# Altium schematic sheet adj_current.SchDoc
size A; SheetNumber: 4; SheetTotal: 4
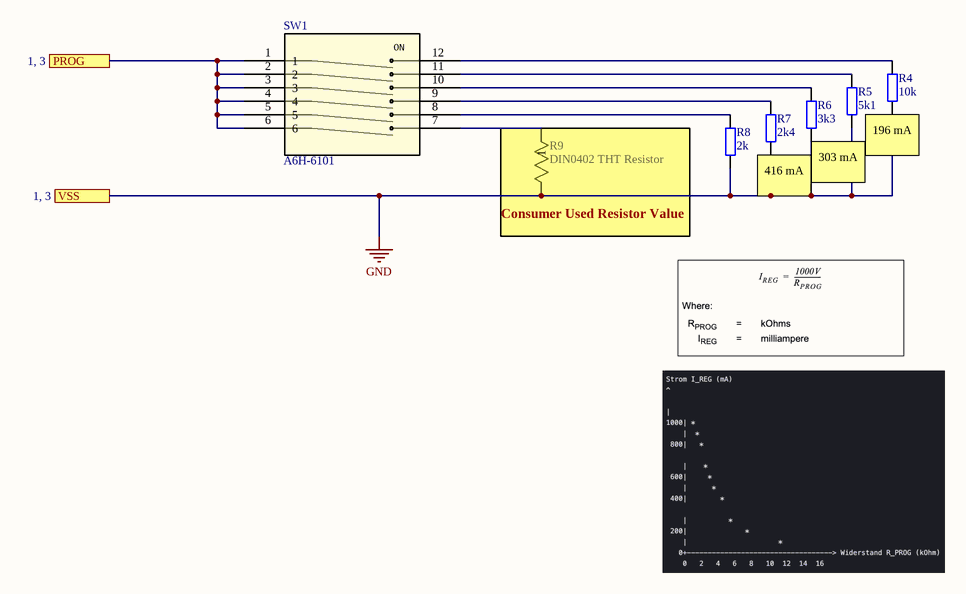
[diagram p0: adj_current.SchDoc]

## Parts
R4  10k  [RES_0603]
R5  5k1  [RES_0603]
R6  3k3  [RES_0603]
R7  2k4  [RES_0603]
R8  2k  [RES_0603]
R9  DIN0402 THT Resistor  [DIN0207 THT Resistor]
SW1  A6H-6101  [SW_A6H-6101_OMR]

## Blocks framed on the sheet
Consumer Used Resistor Value: R9

## Ports
PROG (see 1, 3), VSS (see 1, 3)

## Nets
GND: R4.2 R5.2 R6.2 R7.2 R8.2 R9.2 ; port VSS
PROG: SW1.1 SW1.2 SW1.3 SW1.4 SW1.5 SW1.6 ; port PROG
NetR4_1: R4.1 SW1.12
NetR5_1: R5.1 SW1.11
NetR6_1: R6.1 SW1.10
NetR7_1: R7.1 SW1.9
NetR8_1: R8.1 SW1.8
NetR9_1: R9.1 SW1.7

## Notes on the sheet
- (near R7) 416 mA
- (near R6) 303 mA
- 196 mA
- (in symbol A6H-6101) ON

## Library data of the parts
R4-R8 = RES_0603: Resistor SMD 0603; Manufacturer: *; Manufacturer Part Number: *; Distributor Link: *; LCSC: *
R9 = DIN0402 THT Resistor: Description; Manufacturer_Name: Stackpole International; Manufacturer_Part_Number: CF14JT1K00; Copyright: Copyright (C) 2025 Ultra Librarian. All rights reserved.
SW1 = A6H-6101: Description; Manufacturer_Name: Omron; Copyright: Copyright (C) 2025 Ultra Librarian. All rights reserved.; Manufacturer_Part_Number: A6H-6101; RefDes: RefDes; Type: Type